# EasyEDA Pro project 电刺激_两块板_2026-10-19.epro, schematic Schematic2

## Sheets
1 NNC6121核心: Assembly Variant: Basic; Board Name: Board2; Create Date: 2026-09-04; Page Name: P1; Project Name: 电刺激_两块板; Schematic Name: Schematic2; Update Date: 2026-09-04; Company: 嘉立创EDA; Page Size: A4; Version: V1.0
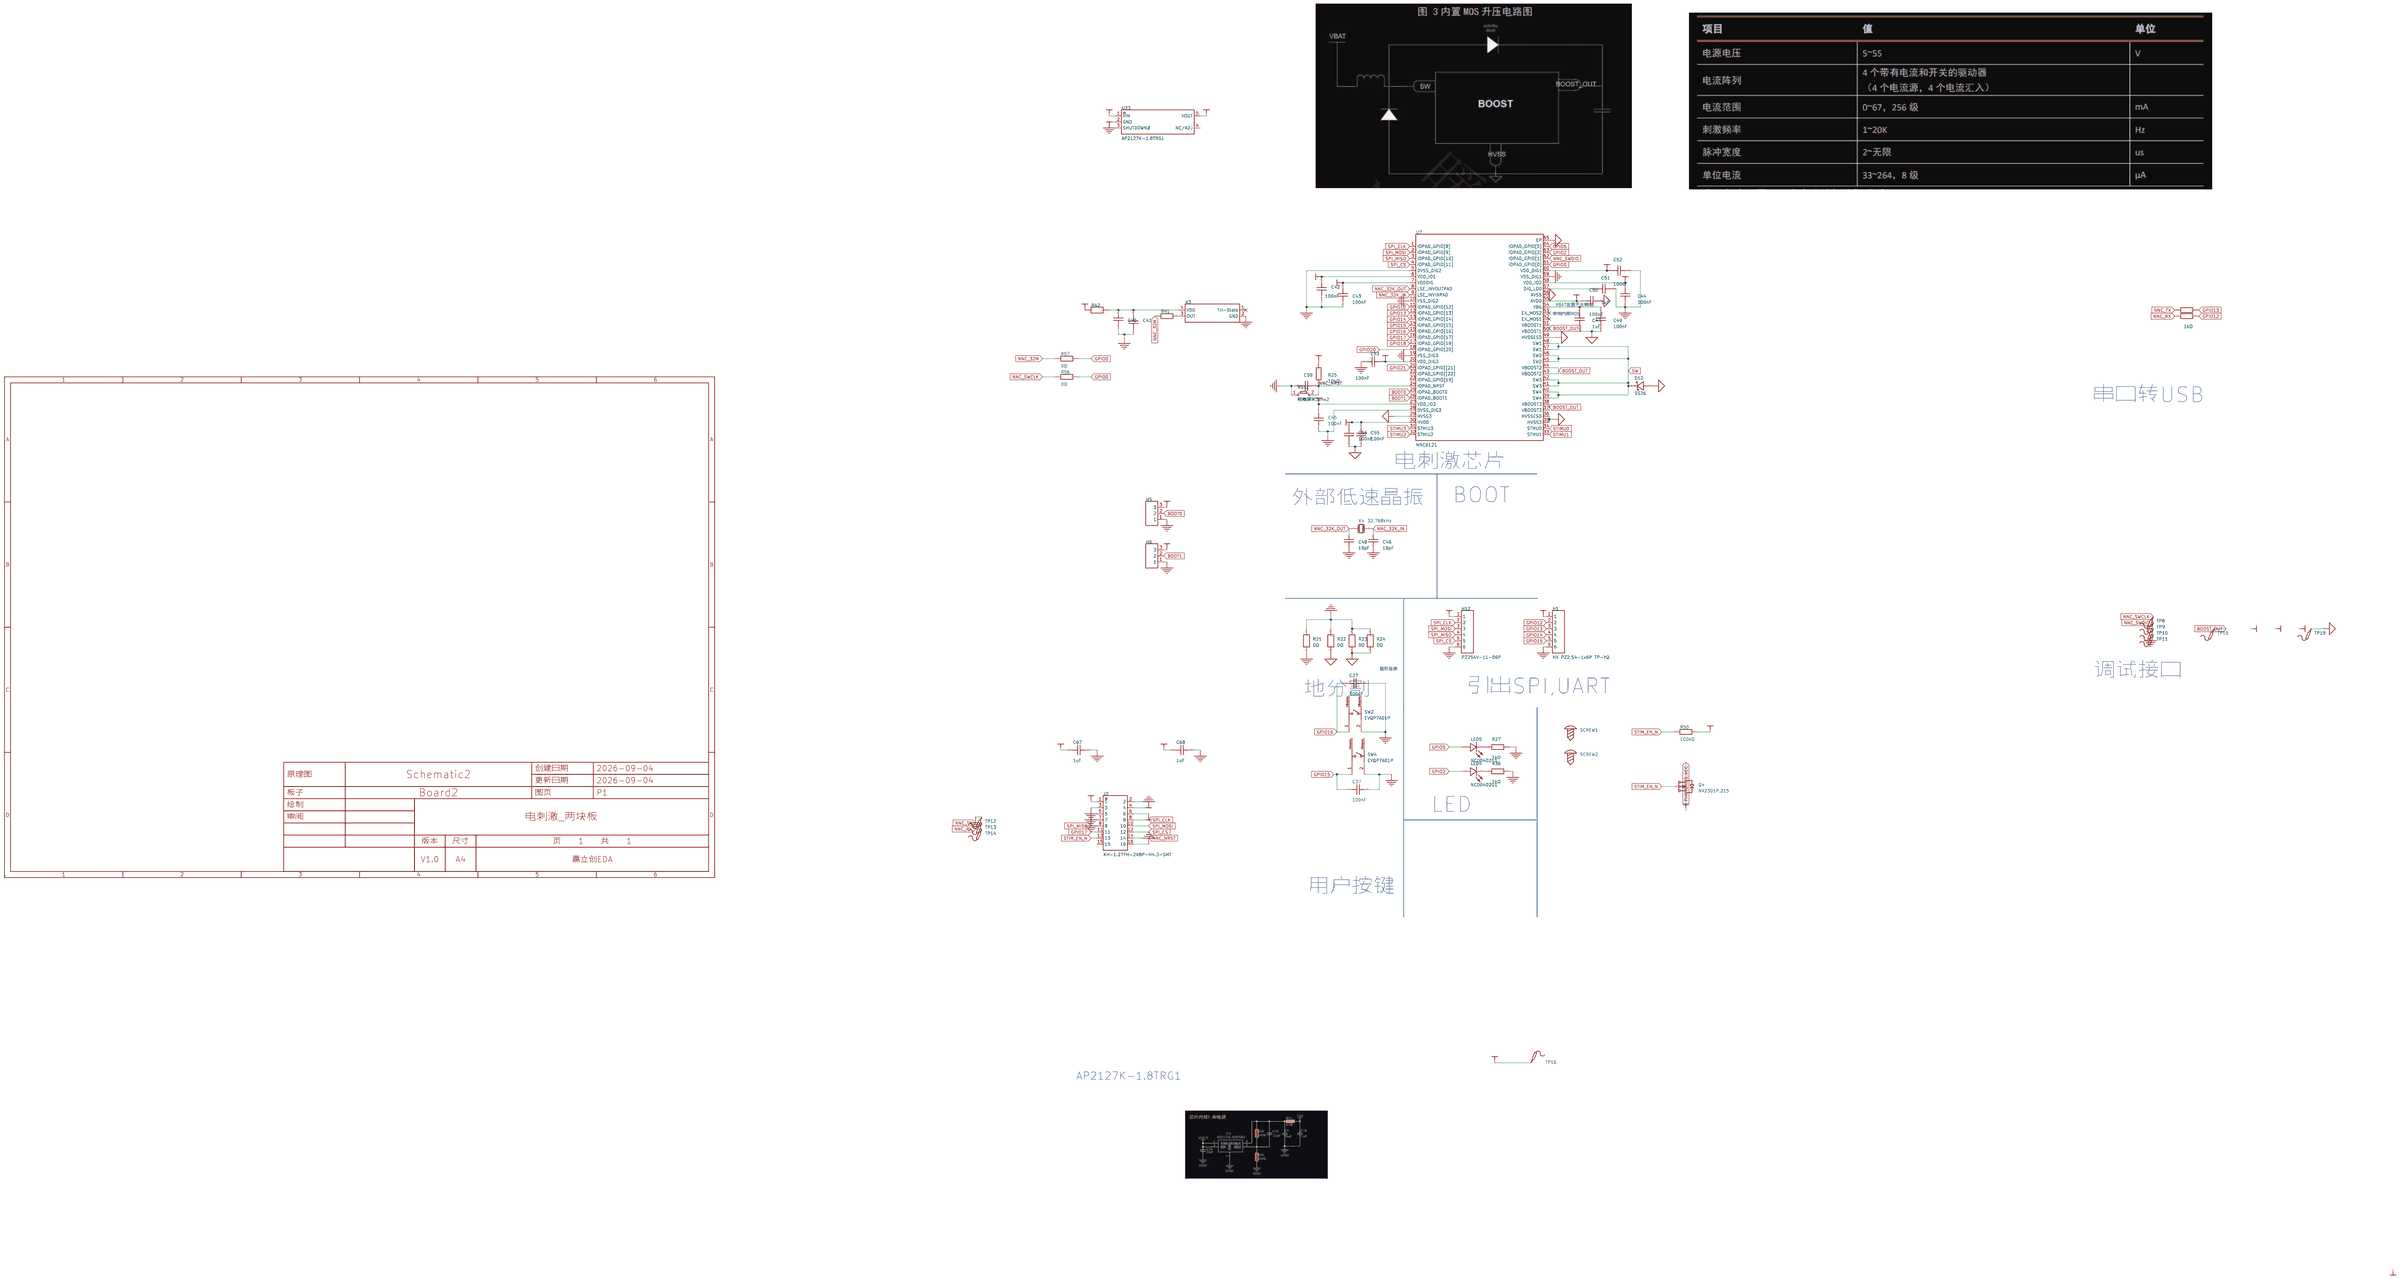
[diagram p0: NNC6121核心]
2 刺激输出: Board Name: 刺激板; Create Date: 2026-10-17; Update Date: 2026-10-17
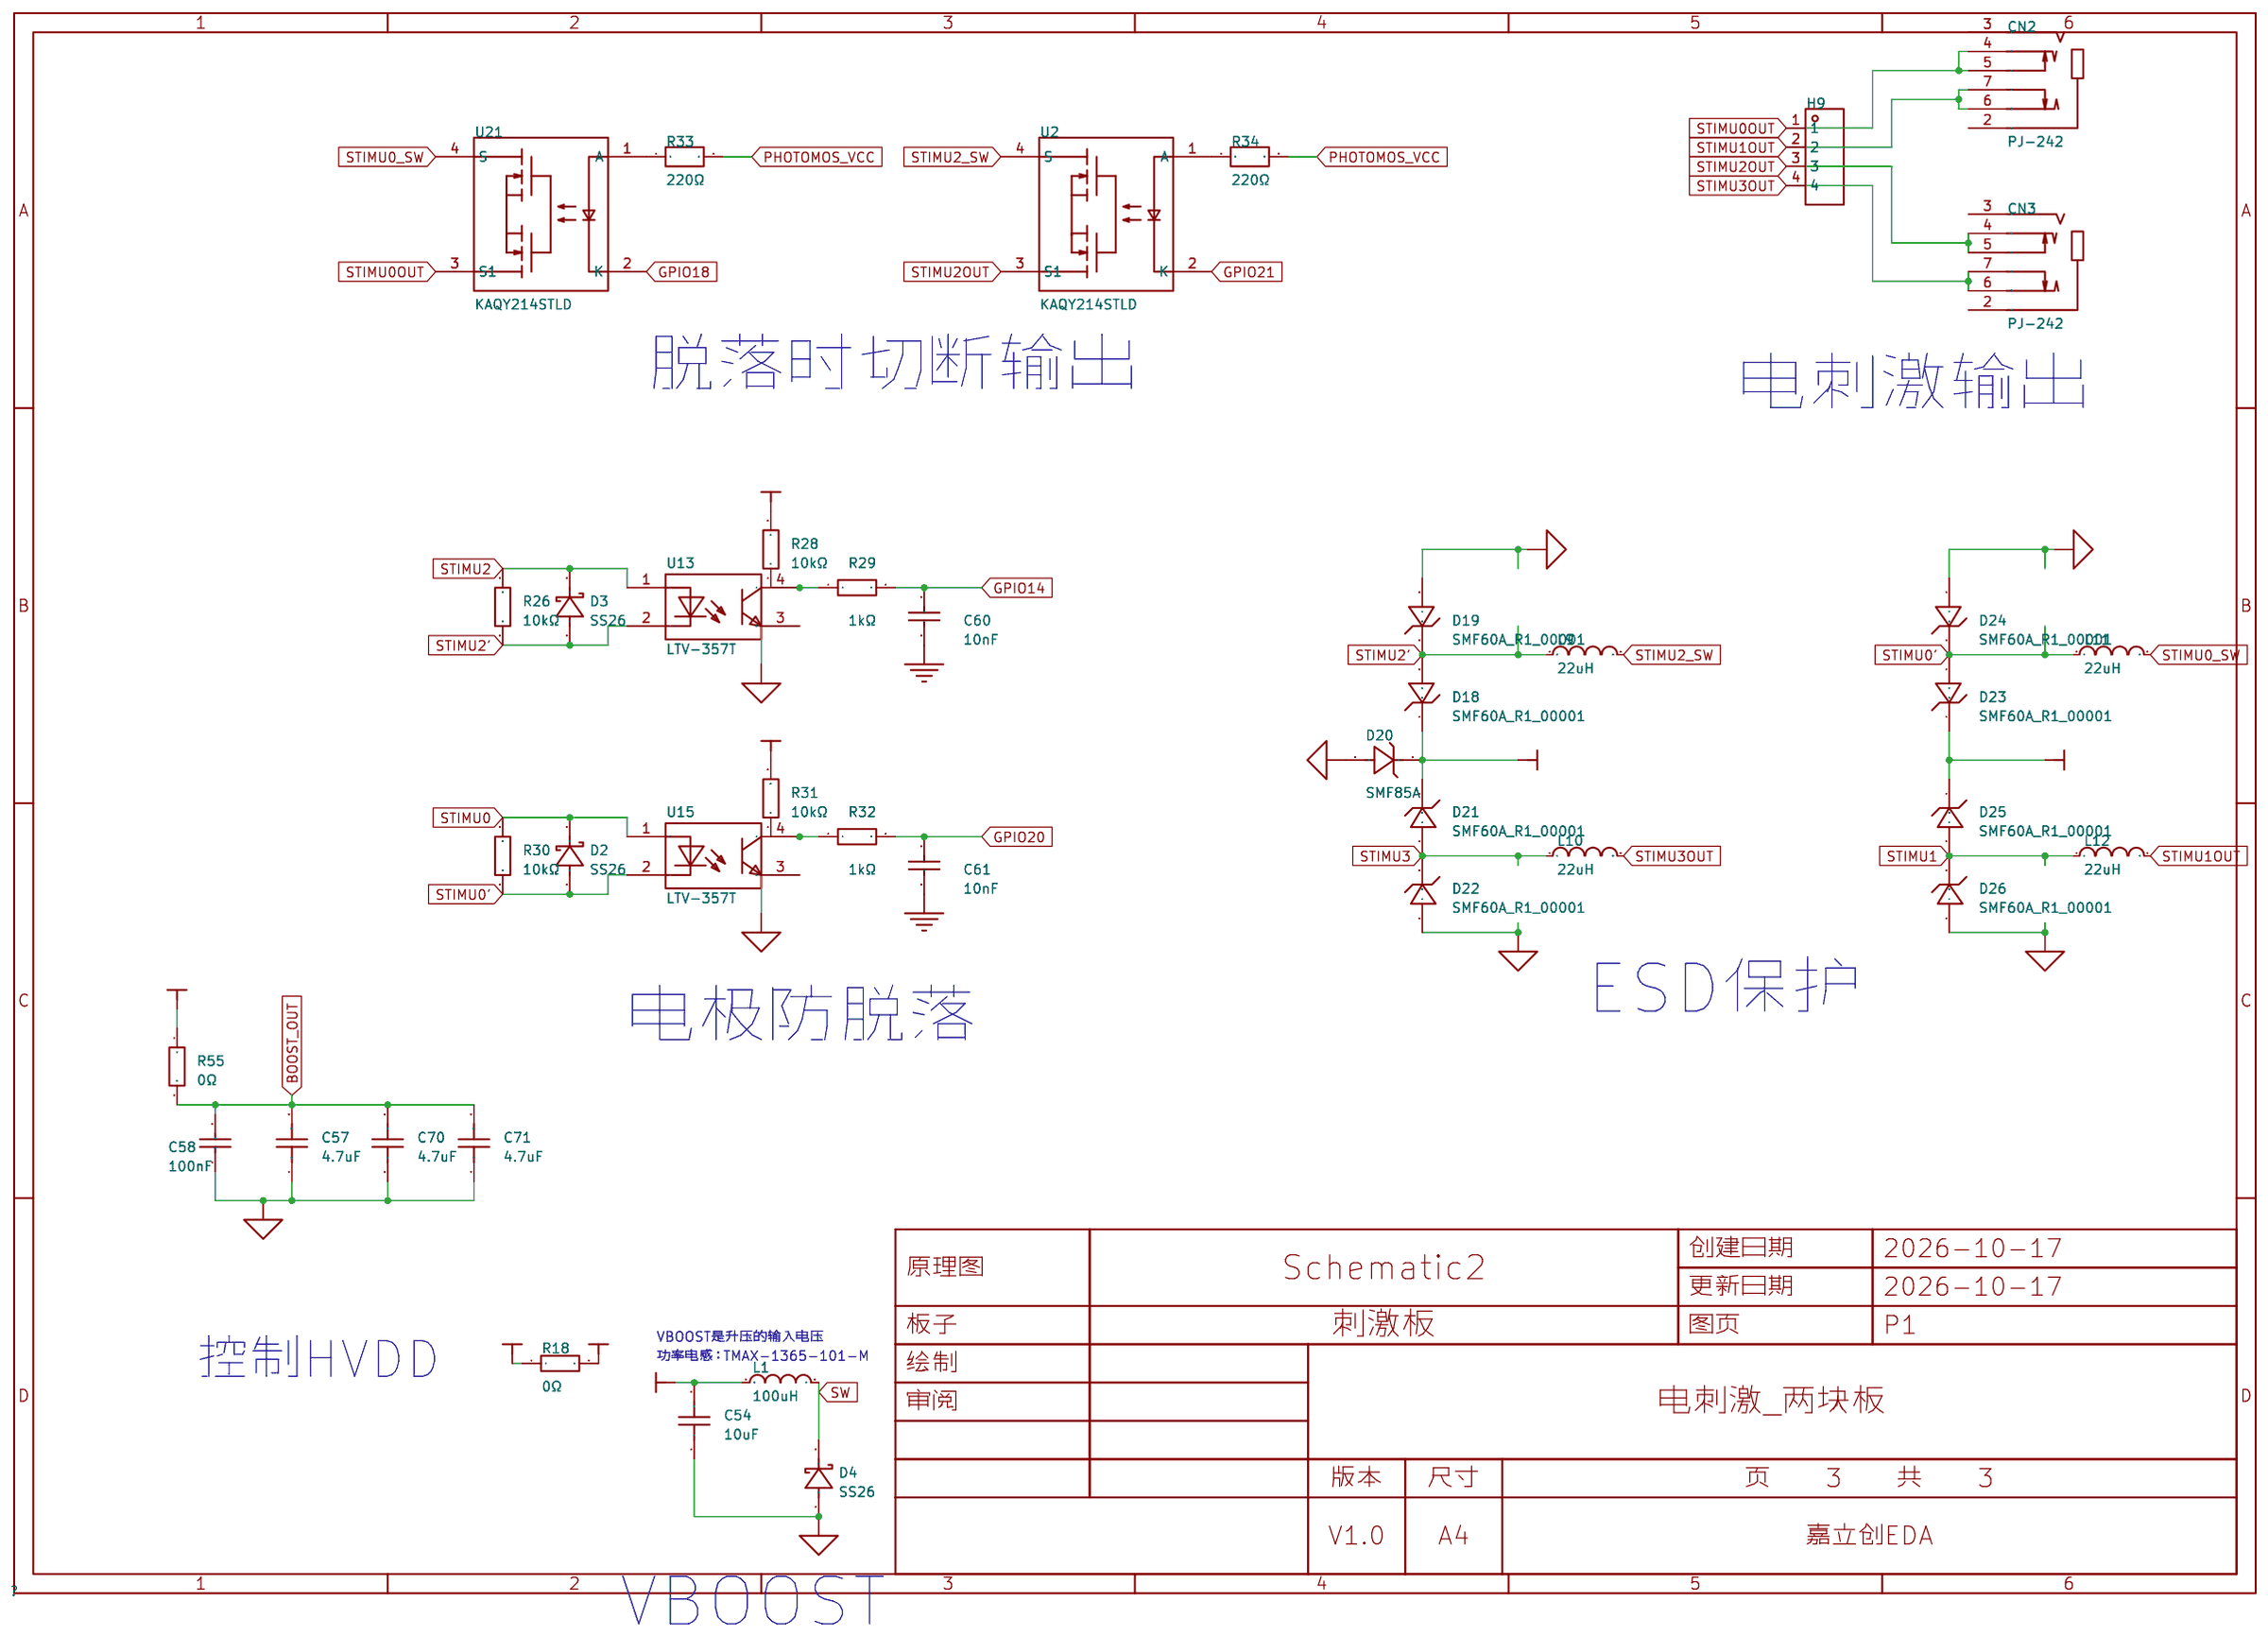
[diagram p1: 刺激输出]

## Parts
sheet NNC6121核心
C27  100nF  [C0402]
C37  100nF  [C0402]
C40  10uF  [C0402]  (no BOM)
C41  100nF  [C0402]  (no BOM)
C42  100nF  [C0402]
C43  100nF  [C0402]
C44  100nF  [C0402]
C45  100nF  [C0402]
C46  18pF  [C0402]
C47  1uF  [C0402]
C48  18pF  [C0402]
C49  100nF  [C0402]
C50  100nF  [C0402]
C51  1uF  [C0402]
C52  100nF  [C0402]
C53  100nF  [C0402]
C55  100nF  [C0603]
C56  100nF  [C0603]
C59  1uF  [C0402]
C67  1uF  [C0402]
C68  1uF  [C0402]
D12  SS26  [SMA_L4.3-W2.6-LS5.0-FD]
H1  HX PZ2.54-1x6P TP-YQ  [HDR-SMD_6P-HX-PZ2.54-1X6P-TP-YQ]  (no BOM)
H5  12251103CNG0S115001  [HDR-TH_3P-P2.54-V-M-1]  (no BOM)
H6  12251103CNG0S115001  [HDR-TH_3P-P2.54-V-M-1]  (no BOM)
H12  PZ254V-11-06P  [HDR-TH_6P-P2.54-V-M]  (no BOM)
J2  KH-1.27FH-2X8P-H4.3-SMT  [CONN-SMD_16P-P1.27_KINGHELM_KH-1.27FH-2X8P-H4.3-SMT]
LED4  NCD0402G1  [LED-SMD_L1.0-W0.5_FC-F1005UGK]
LED5  NCD0402G1  [LED-SMD_L1.0-W0.5_FC-F1005UGK]
Q4  NX2301P,215  [SOT-23-3_L2.9-W1.3-P1.90-LS2.4-BR]
R19  1kΩ  [R0402]
R20  1kΩ  [R0402]
R21  0Ω  [R0805]
R22  0Ω  [R0805]
R23  0Ω  [R0805]
R24  0Ω  [R0805]
R25  10kΩ  [R0402]
R27  1kΩ  [R0402]
R36  1kΩ  [R0402]
R41  22Ω  [R0402]  (no BOM)
R42  120Ω  [R0402]  (no BOM)
R50  100kΩ  [R0402]
R56  0Ω  [R0603]
R57  0Ω  [R0603]  (no BOM)
RST1  轻触开关3x4x2  [Key_SMD_3x4x2]
SCREW1  -  [M2螺丝]  (no BOM)
SCREW2  -  [M2螺丝]  (no BOM)
SW2  EVQP7A01P  [SW-SMD_EVQP7A01P]
SW4  EVQP7A01P  [SW-SMD_EVQP7A01P]
TP8  -  [Test-Point-0.5mm]  (no BOM)
TP9  -  [Test-Point-0.5mm]  (no BOM)
TP10  -  [Test-Point-0.5mm]  (no BOM)
TP11  -  [Test-Point-0.5mm]  (no BOM)
TP12  -  [Test-Point-0.5mm]  (no BOM)
TP13  -  [Test-Point-0.5mm]  (no BOM)
TP14  -  [Test-Point-0.5mm]  (no BOM)
TP15  -  [Test-Point-0.5mm]  (no BOM)
TP16  -  [Test-Point-0.5mm]  (no BOM)
TP19  -  [Test-Point-0.5mm]  (no BOM)
U7  NNC6121  [QFN-64_L7.0-W7.0-P0.35-TL-EP4.0]
U23  AP2127K-1.8TRG1  [SOT-23-5_L3.0-W1.7-P0.95-LS2.8-BR]
X3  32MHz  [OSC-SMD_4P-L2.0-W1.6-BL]  (no BOM)
X4  32.768kHz  [OSC-SMD_2P-L3.2-W1.5]
sheet 刺激输出
C54  10uF  [C0805]
C57  4.7uF  [C1210]
C58  100nF  [C0805]
C60  10nF  [C0402]
C61  10nF  [C0402]
C70  4.7uF  [C1210]
C71  4.7uF  [C1210]
CN2  PJ-242  [AUDIO-SMD_PJ-242_1]  (no BOM)
CN3  PJ-242  [AUDIO-SMD_PJ-242_1]  (no BOM)
D2  SS26  [SMA_L4.3-W2.6-LS5.0-FD]
D3  SS26  [SMA_L4.3-W2.6-LS5.0-FD]
D4  SS26  [SMA_L4.3-W2.6-LS5.0-FD]
D18  SMF60A_R1_00001  [SOD-123FL_L2.7-W1.8-LS3.8-RD]
D19  SMF60A_R1_00001  [SOD-123FL_L2.7-W1.8-LS3.8-RD]
D20  SMF85A  [SOD-123FL_L2.7-W1.8-LS3.7-RD]
D21  SMF60A_R1_00001  [SOD-123FL_L2.7-W1.8-LS3.8-RD]
D22  SMF60A_R1_00001  [SOD-123FL_L2.7-W1.8-LS3.8-RD]
D23  SMF60A_R1_00001  [SOD-123FL_L2.7-W1.8-LS3.8-RD]
D24  SMF60A_R1_00001  [SOD-123FL_L2.7-W1.8-LS3.8-RD]
D25  SMF60A_R1_00001  [SOD-123FL_L2.7-W1.8-LS3.8-RD]
D26  SMF60A_R1_00001  [SOD-123FL_L2.7-W1.8-LS3.8-RD]
H9  PZ254V-11-04P  [HDR-TH_4P-P2.54-V-M]
L1  100uH  [IND-SMD_L7.1-W6.6]
L9  22uH  [IND-SMD_L2.5-W2.0_SWPA252012S]
L10  22uH  [IND-SMD_L2.5-W2.0_SWPA252012S]
L11  22uH  [IND-SMD_L2.5-W2.0_SWPA252012S]
L12  22uH  [IND-SMD_L2.5-W2.0_SWPA252012S]
R18  0Ω  [R0603]
R26  10kΩ  [R0402]
R28  10kΩ  [R0402]
R29  1kΩ  [R0402]
R30  10kΩ  [R0402]
R31  10kΩ  [R0402]
R32  1kΩ  [R0402]
R33  220Ω  [R0402]
R34  220Ω  [R0402]
R55  0Ω  [R0603]  (no BOM)
U2  KAQY214STLD  [SOP-4_L3.9-W4.4-P2.54-LS7.0-BR]
U13  LTV-357T  [SOP-4_L3.9-W4.4-P2.54-LS7.0-TL]
U15  LTV-357T  [SOP-4_L3.9-W4.4-P2.54-LS7.0-TL]
U21  KAQY214STLD  [SOP-4_L3.9-W4.4-P2.54-LS7.0-BR]

## Library data of the parts
C27 C37 C42-C45 C49 C50 C52 C53 = CL05B104KB54PNC: 容值:100nF;精度:±10%;额定电压:50V;温度系数:X7R;; LCSC Part Name: 100nF ±10% 50V; Supplier Part: C307331; Manufacturer: SAMSUNG(三星); Supplier Footprint: 0402; JLCPCB Part Class: Basic Part; Datasheet: https://item.szlcsc.com/datasheet/CL05B104KB54PNC/291005.html; Supplier: LCSC; Tolerance: ±10%; Voltage Rating: 50V; Temperature Coefficient: X7R
C40 = CL05A106MQ5NUNC: 容值:10uF;精度:±20%;额定电压:6.3V;温度系数:X5R;; LCSC Part Name: 10uF ±20% 6.3V; Supplier Part: CL05A106MQ5NUNC.1; Manufacturer: SAMSUNG(三星); Supplier Footprint: 0402; JLCPCB Part Class: Basic Part; Datasheet: https://item.szlcsc.com/datasheet/CL05A106MQ5NUNC/16204.html; Supplier: LCSC; Tolerance: ±20%; Voltage Rating: 6.3V; Temperature Coefficient: X5R
C41 = CL05B104KB54PNC: 容值:100nF;精度:±10%;额定电压:50V;温度系数:X7R;; LCSC Part Name: 100nF ±10% 50V; Supplier Part: CL05B104KB54PNC.1; Manufacturer: SAMSUNG(三星); Supplier Footprint: 0402; JLCPCB Part Class: Basic Part; Datasheet: https://item.szlcsc.com/datasheet/CL05B104KB54PNC/291005.html; Supplier: LCSC; Tolerance: ±10%; Voltage Rating: 50V; Temperature Coefficient: X7R
C46 C48 = GJM1555C1H150FB01D: 容值:18pF;精度:±5%;额定电压:50V;材质(温度系数):C0G;; LCSC Part Name: 18pF ±5% 50V; Supplier Part: C1549; Manufacturer: FH(风华); Manufacturer Part: 0402CG180J500NT; Supplier Footprint: 0402; JLCPCB Part Class: Basic Part; Datasheet: https://atta.szlcsc.com/upload/public/pdf/source/20200305/C490387_23319AE8C154DEB24C505E6C82A8106A.pdf; Supplier: LCSC; Tolerance: ±5%; Voltage Rated: 50V; Temperature Coefficient: C0G
C47 C51 C59 C67 C68 = CL05A105KA5NQNC: 容值:1uF;精度:±10%;额定电压:25V;温度系数:X5R;; LCSC Part Name: 1uF ±10% 25V; Supplier Part: C52923; Manufacturer: SAMSUNG(三星); Supplier Footprint: 0402; JLCPCB Part Class: Basic Part; Datasheet: https://item.szlcsc.com/datasheet/CL05A105KA5NQNC/53938.html; Supplier: LCSC; Tolerance: ±10%; Voltage Rating: 25V; Temperature Coefficient: X5R
C55 C56 = CL10B104KC8NNNC: 容值:100nF;精度:±10%;额定电压:100V;温度系数:X7R;; LCSC Part Name: 100nF ±10% 100V; Supplier Part: C15725; Manufacturer: SAMSUNG(三星); Supplier Footprint: 0603; JLCPCB Part Class: Extended Part; Datasheet: https://item.szlcsc.com/datasheet/CL10B104KC8NNNC/16407.html; Supplier: LCSC; Tolerance: ±10%; Voltage Rating: 100V; Temperature Coefficient: X7R
D2-D4 D12 = SS26_C7420363: 二极管配置:独立式;正向压降(Vf):700mV@2A;直流反向耐压(Vr):60V;整流电流:2A;; LCSC Part Name: 电压:60V 电流:2A; Supplier Part: C7420363; Manufacturer: R+O(宏嘉诚); Supplier Footprint: SMA(DO-214AC); JLCPCB Part Class: Extended Part; Datasheet: https://item.szlcsc.com/datasheet/SS26/8397185.html; Supplier: LCSC; Diode Configuration: 独立式; Voltage - Forward(Vf@If): 700mV@2A; Voltage - DC Reverse(Vr): 60V; Current - Rectified: 2A; Reverse Leakage Current (Ir): 200uA@60V; Operating Junction Temperature Range: -55℃~+150℃; Non-Repetitive Peak Forward Surge Current: 50A
H1 = HX PZ2.54-1x6P TP-YQ: 插针结构:1x6P;间距:2.54mm;行距:-;圆针/方针:方针;安装方式:立贴;排数:单排;总PIN位数:6P;额定电流:3A;额定电压:1kV;配合针长度:6mm;塑高:2.5mm;端接针长度:-;触头材质:黄铜;触头镀层:金;工作温度:-40℃~+105℃;颜色:黑色;; LCSC Part Name: 1x6P 间距:2.54mm 方针 立贴; Supplier Part: C41417363; Manufacturer: hanxia(韩下); Supplier Footprint: SMD,P=2.54mm(交错脚); JLCPCB Part Class: Extended Part; Datasheet: https://item.szlcsc.com/datasheet/HX%2520PZ2.54-1x6P%2520TP-YQ/43243367.html; Supplier: LCSC; Pin Structure: 1x6P; Pitch: 2.54mm; Circluar Pins/Square Pins: 方针; Mounting Type: 立贴; Number of Rows: 单排; Number of Pins: 6P; Current Rating: 3A; Voltage Rating (Max): 1kV; Length of Mating Pin: 6mm; Insulation Height: 2.5mm; Contact Material: 黄铜; Contact Plating: 金; Operating Temperature: -40℃~+105℃; Color: 黑色
H5 H6 = 12251103CNG0S115001: 插针结构:1x3P;间距:2.54mm;行距:-;圆针/方针:方针;安装方式:直插;排数:单排;总PIN位数:3P;额定电流:3A;额定电压:-;配合针长度:6mm;塑高:2.5mm;端接针长度:3mm;触头材质:黄铜;触头镀层:-;工作温度:-40℃~+105℃;颜色:黑色;; LCSC Part Name: 1x3P 间距:2.54mm 方针 直插; Supplier Part: C429954; Manufacturer: JILN(锦凌); Supplier Footprint: 插件,P=2.54mm; JLCPCB Part Class: Extended Part; Datasheet: https://item.szlcsc.com/datasheet/12251103CNG0S115001/426406.html; Supplier: LCSC; Pin Structure: 1x3P; Pitch: 2.54mm; Circluar Pins/Square Pins: 方针; Mounting Type: 直插; Number of Rows: 单排; Number of Pins: 3P; Current Rating: 3A; Length of Mating Pin: 6mm; Insulation Height: 2.5mm; Length of End Connection Pin: 3mm; Contact Material: 黄铜; Operating Temperature: -40℃~+105℃; Color: 黑色
H12 = PZ254V-11-06P: 插针结构:1x6P;间距:2.54mm;行距:-;圆针/方针:方针;安装方式:直插;排数:单排;总PIN位数:6P;额定电流:3A;额定电压:250V;配合针长度:6mm;塑高:2.5mm;端接针长度:3mm;触头材质:黄铜;触头镀层:-;工作温度:-40℃~+105℃;颜色:黑色;; LCSC Part Name: 1x6P 间距:2.54mm 方针 直插; Supplier Part: C492405; Manufacturer: XFCN(兴飞); Supplier Footprint: 插件,P=2.54mm; JLCPCB Part Class: Extended Part; Datasheet: https://item.szlcsc.com/datasheet/PZ254V-11-06P/502961.html; Supplier: LCSC; Pin Structure: 1x6P; Pitch: 2.54mm; Circluar Pins/Square Pins: 方针; Mounting Type: 直插; Number of Rows: 单排; Number of Pins: 6P; Current Rating: 3A; Voltage Rating (Max): 250V; Length of Mating Pin: 6mm; Insulation Height: 2.5mm; Length of End Connection Pin: 3mm; Contact Material: 黄铜; Operating Temperature: -40℃~+105℃; Color: 黑色
J2 = KH-1.27FH-2X8P-H4.3-SMT: 插孔结构:2x8P;间距:1.27mm;行距:1.27mm;圆孔/方孔:方孔;安装方式:立贴;排数:双排;总孔位数:16P;额定电流:1A;额定电压:-;插孔方向:顶部;塑高:4.3mm;工作温度:-40℃~+105℃;; LCSC Part Name: 间距:1.27mm 2x8P 立贴; Supplier Part: C2938398; Manufacturer: kinghelm(金航标); Supplier Footprint: SMD,P=1.27mm; JLCPCB Part Class: Extended Part; Datasheet: https://item.szlcsc.com/datasheet/KH-1.27FH-2X8P-H4.3-SMT/3294778.html; Supplier: LCSC; Holes Structure: 2x8P; Pitch: 1.27mm; Row Spacing: 1.27mm; Circular Hole / Square Hole: 方孔; Mounting Type: 立贴; Number of Rows: 双排; Number of Positions: 16P; Current Rating: 1A; Holes Direction: 顶部; Insulation Height: 4.3mm; Operating Temperature: -40℃~+105℃
LED4 LED5 = NCD0402G1: 灯头类型:-;发光颜色:翠绿色;正向压降(Vf):2.6V~3.6V;功率:72mW;正向电流:20mA;波长:515nm~530nm;二极管配置:独立二极管;透镜颜色:-;色温:-;发光强度:270mcd;发光角度:130°;载带方式:-;工作温度:-30℃~+85℃;; LCSC Part Name: 片式发光二极管; Supplier Part: C130723; Manufacturer: 国星光电; Supplier Footprint: 0402; JLCPCB Part Class: Extended Part; Datasheet: https://item.szlcsc.com/datasheet/NCD0402G1/142012.html; Supplier: LCSC; Illumination Color: 翠绿色; Voltage - Forward(Vf): 2.6V~3.6V; Power(Watts): 72mW; Forward Current: 20mA; Wavelength - Dominant: 515nm~530nm; Peak Wavelength: 520nm; Diode Configuration: 独立二极管; Luminous Intensity: 270mcd; Viewing Angle: 130°; Operating Temperature: -30℃~+85℃
Q4 = NX2301P,215: 数量:1个P沟道;漏源电压(Vdss):20V;连续漏极电流(Id):2A;导通电阻(RDS(on)):120mΩ@4.5V;耗散功率(Pd):400mW;阈值电压(Vgs(th)):1.1V;; LCSC Part Name: 1个P沟道 耐压:20V 电流:2A; Supplier Part: C191273; Manufacturer: Nexperia(安世); Supplier Footprint: SOT-23; JLCPCB Part Class: Extended Part; Datasheet: https://item.szlcsc.com/datasheet/NX2301P%252C215/214510.html; Supplier: LCSC; Number: 1个P沟道; Drain to Source Voltage: 20V; Current - Continuous Drain(Id): 2A; RDS(on): 120mΩ@4.5V; Pd - Power Dissipation: 400mW; Gate Threshold Voltage (Vgs(th)): 1.1V; Gate Charge(Qg): 6nC@4.5V; Input Capacitance(Ciss): 380pF; Reverse Transfer Capacitance (Crss@Vds): 115pF; Operating Temperature: -55℃~+150℃; Type: P沟道; Output Capacitance(Coss): 135pF; Vgs: ±8V
R19 R20 R27 R29 R32 R36 = RC0402FR-071KL: 电阻类型:厚膜电阻;阻值:1kΩ;精度:±1%;功率:62.5mW;工作电压:50V;温度系数:±100ppm/℃;; LCSC Part Name: 厚膜电阻 1kΩ ±1% 62.5mW; Supplier Part: C106235; Manufacturer: YAGEO(国巨); Supplier Footprint: 0402; JLCPCB Part Class: Extended Part; Datasheet: https://item.szlcsc.com/datasheet/RC0402FR-071KL/107450.html; Supplier: LCSC; Type: 厚膜电阻; Tolerance: ±1%; Power(Watts): 62.5mW; Voltage-Supply(Max): 50V; Temperature Coefficient: ±100ppm/℃; Operating Temperature: -55℃~+155℃
R21-R24 = RE0805FAR000: 电阻类型:合金电阻;阻值:0Ω;精度:±1%;功率:500mW;温度系数:±50ppm/℃;安装方式:贴片;; LCSC Part Name: 0Ω ±1% 125mW 厚膜电阻; Supplier Part: C17477; Manufacturer: UNI-ROYAL(厚声); Manufacturer Part: 0805W8F0000T5E; Supplier Footprint: 0805; JLCPCB Part Class: Basic Part; Datasheet: https://item.szlcsc.com/datasheet/0805W8F0000T5E/18165.html; Supplier: LCSC; Type: 厚膜电阻; Tolerance: ±1%; Power(Watts): 125mW; Temperature Coefficient: ±800ppm/℃; Mounting Type: 贴片; Voltage-Supply(Max): 150V; Operating Temperature: -55℃~+155℃
R25 R26 R28 R30 R31 = RT0402BRD0710KL: 电阻类型:薄膜电阻;阻值:10kΩ;精度:±0.1%;功率:62.5mW;工作电压:50V;温度系数:±25ppm/℃;; LCSC Part Name: 薄膜电阻 10kΩ ±0.1% 62.5mW; Supplier Part: C190095; Manufacturer: YAGEO(国巨); Supplier Footprint: 0402; JLCPCB Part Class: Extended Part; Datasheet: https://item.szlcsc.com/datasheet/RT0402BRD0710KL/208478.html; Supplier: LCSC; Type: 薄膜电阻; Tolerance: ±0.1%; Power(Watts): 62.5mW; Voltage-Supply(Max): 50V; Temperature Coefficient: ±25ppm/℃; Operating Temperature: -55℃~+155℃
R41 = 0402WGJ0220TCE: 电阻类型:厚膜电阻;阻值:22Ω;精度:±5%;功率:62.5mW;工作电压:50V;温度系数:±100ppm/℃;; LCSC Part Name: 22Ω ±5% 62.5mW 厚膜电阻; Supplier Part: 0402WGJ0220TCE.1; Manufacturer: UNI-ROYAL(厚声); Supplier Footprint: 0402; JLCPCB Part Class: Extended Part; Datasheet: https://item.szlcsc.com/datasheet/0402WGJ0220TCE/25895.html; Supplier: LCSC; Type: 厚膜电阻; Tolerance: ±5%; Power(Watts): 62.5mW; Voltage-Supply(Max): 50V; Temperature Coefficient: ±100ppm/℃; Operating Temperature: -55℃~+155℃
R42 = ERJ2RKF1200X: 电阻类型:厚膜电阻;阻值:120Ω;精度:±1%;功率:100mW;最大工作电压:-;温度系数:±100ppm/℃;; LCSC Part Name: 120Ω ±1% 100mW 厚膜电阻; Supplier Part: ERJ2RKF1200X.1; Manufacturer: PANASONIC(松下); Supplier Footprint: 0402; JLCPCB Part Class: Extended Part; Datasheet: https://atta.szlcsc.com/upload/public/pdf/source/20190820/C413065_DC6FBADB38D14E1C8267D4574BBF0082.pdf; Supplier: LCSC; Type: 厚膜电阻; Tolerance: ±1%; Power(Watts): 100mW; Temperature Coefficient: ±100ppm/℃; Operating Temperature Range: -55℃~+155℃
R50 = RC0402FR-07100KL: 电阻类型:厚膜电阻;阻值:100kΩ;精度:±1%;功率:62.5mW;工作电压:50V;温度系数:±100ppm/℃;; LCSC Part Name: 厚膜电阻 100kΩ ±1% 62.5mW; Supplier Part: C60491; Manufacturer: YAGEO(国巨); Supplier Footprint: 0402; JLCPCB Part Class: Extended Part; Datasheet: https://item.szlcsc.com/datasheet/RC0402FR-07100KL/61543.html; Supplier: LCSC; Type: 厚膜电阻; Tolerance: ±1%; Power(Watts): 62.5mW; Voltage-Supply(Max): 50V; Temperature Coefficient: ±100ppm/℃; Operating Temperature: -55℃~+155℃
R18 R56 R57 = 0603WAF0000T5E: 电阻类型:厚膜电阻;阻值:0Ω;精度:±1%;功率:100mW;工作电压:75V;温度系数:-;; LCSC Part Name: 厚膜电阻 0Ω ±1%; Supplier Part: C21189; Manufacturer: UNI-ROYAL(厚声); Supplier Footprint: 0603; JLCPCB Part Class: Basic Part; Datasheet: https://item.szlcsc.com/datasheet/0603WAF0000T5E/21903.html; Supplier: LCSC; Type: 厚膜电阻; Tolerance: ±1%; Power(Watts): 100mW; Voltage-Supply(Max): 75V; Operating Temperature: -55℃~+155℃
RST1 = Key_SMD_3x4x2: Supplier Footprint: SMD; Manufacturer: 国产; Supplier: LCSC; Supplier Part: C26638; LCSC Part Name: 4*3*2mm 立贴 轻触开关; JLCPCB Part Class: Extended Part; Datasheet: https://atta.szlcsc.com/upload/public/pdf/source/20150923/1457707412058.pdf; Circuit: 单刀单掷; Actuator Style: 圆形按钮; Mounting Style: 立贴; Switch Length: 4mm; Switch Width: 3mm; Switch Height: 2mm; Contact Current: 50mA; Voltage Rating (DC): 12V
SCREW1 SCREW2 = M2螺丝: Supplier Footprint: 插件; Supplier Part: M3螺丝.1
SW2 SW4 = EVQP7A01P: 电路结构:单刀单掷;按钮形状:矩形按钮;作用力:2.2N;安装方式:卧贴;开关长度:3.5mm;开关宽度:3.55mm;开关高度:1.35mm;触点电流:50mA;额定电压:12V;带灯:-;工作寿命:10万次;; LCSC Part Name: 3.5*3.55*1.35mm 卧贴 轻触开关; Supplier Part: C79167; Manufacturer: PANASONIC(松下); Supplier Footprint: SMD,3.5x3.6mm; JLCPCB Part Class: Extended Part; Datasheet: https://item.szlcsc.com/datasheet/EVQP7A01P/80304.html; Supplier: LCSC; Circuit: 单刀单掷; Actuator Style: 矩形按钮; Operating Force: 2.2N; Mounting Type: 卧贴; Length: 3.5mm; Width: 3.55mm; Switch Height: 1.35mm; Contact Current: 50mA; Voltage Rating: 12V; Termination Style: 焊片; Life: 10万次; Operating Temperature: -20℃~+70℃
TP8-TP15 TP19 = Test-Point: Test Point 测试点; Supplier Part: Test-Point.1
TP16 = Test-Point: Test Point 测试点
U7 = NNC6121: NNC6121芯片是一款集成了32MHz ARM处理器的双通道神经刺激芯片，能够实现DC到50kHz的任意恒流源波形输出，可以覆盖传统的正弦波/方波/三角波及各种调制波形，可应用于体外神经/肌肉电刺激等众多领域。电压最高为单向60V  刺激脉宽大于10us，量程：1~67mA，系统OSC：HSI_32M +-2%，产品FLASH空间：28KB; LCSC Part Name: 高集成可编程刺激芯片; Supplier Part: C42396791; Manufacturer: NANOCHAP(暖芯迦); Supplier Footprint: QFN-64L(7x7); JLCPCB Part Class: Extended Part; Datasheet: https://item.szlcsc.com/datasheet/NNC6121/44345719.html; Supplier: LCSC
U23 = AP2127K-1.8TRG1: 输出极性:正极;工作电压:6V;输出电压:1.8V;输出电流:300mA;电源纹波抑制比(PSRR):68dB@(1kHz);输出类型:固定;; LCSC Part Name: 1.8V 300mA 6V; Supplier Part: C151375; Manufacturer: DIODES(美台); Supplier Footprint: SOT-23-5; JLCPCB Part Class: Extended Part; Datasheet: https://item.szlcsc.com/datasheet/AP2127K-1.8TRG1/162715.html; Supplier: LCSC; Output Configuration: 正极; Voltage - Supply: 6V; Output Voltage: 1.8V; Output Current: 300mA; Power Supply Rejection Ratio (PSRR): 68dB@(1kHz); Voltage Dropout: 600mV@(300mA); standby current: 60uA; Noise: 60uVrms; Features: 使能控制；输出放电；内置软启动；过流保护；短路保护；热关断; Operating Temperature: -40℃~+85℃@(Ta); Output Type: 固定; Number of Outputs: 1
X3 = OT7EL89CJI-111YLC-32M: 频率:32MHz;常温频差:±10ppm;输出模式:CMOS;工作电压:1.8V~3.3V;频率稳定度:±20ppm;; LCSC Part Name: YSO110TR 32MHZ 1.8V-3.3V ±10PPM -40~85℃ (±20PPM) CMOS; Supplier Part: OT7EL89CJI-111YLC-32M.1; Manufacturer: YXC(扬兴晶振); Supplier Footprint: SMD2016-4P; JLCPCB Part Class: Extended Part; Datasheet: https://item.szlcsc.com/datasheet/OT7EL89CJI-111YLC-32M/29374969.html; Supplier: LCSC; Normal temperature Frequency Tolerance: ±10ppm; Output Type: CMOS; Voltage - Supply: 1.8V~3.3V; Frequency Stability: ±20ppm; Operating Temperature: -40℃~+85℃
X4 = CM315D32768DZFT: 晶振类型:-;频率:32.768kHz;常温频差:±20ppm;外接负载电容:12.5pF;; LCSC Part Name: 32.768kHz ±20ppm 12.5pF; Supplier Part: C182057; Manufacturer: CITIZEN; Supplier Footprint: SMD3215-2P; JLCPCB Part Class: Extended Part; Datasheet: https://atta.szlcsc.com/upload/public/pdf/source/20180224/C182057_15194369676281363999.pdf; Supplier: LCSC; Normal temperature Frequency Tolerance: ±20ppm; External load capacitor: 12.5pF; Equivalent Series Resistance (ESR): 70kΩ; Operating Temperature: -40℃~+85℃
C54 = CGA0805X5R106K500MT: 容值:10uF;精度:±10%;额定电压:50V;温度系数:X5R;; LCSC Part Name: 10uF ±10% 50V; Supplier Part: C6119889; Manufacturer: HRE(芯声); Supplier Footprint: 0805; JLCPCB Part Class: Extended Part; Datasheet: https://item.szlcsc.com/datasheet/CGA0805X5R106K500MT/7062595.html; Supplier: LCSC; Tolerance: ±10%; Voltage Rating: 50V; Temperature Coefficient: X5R
C57 C70 C71 = GRM32ER72A475KE14L: 容值:4.7uF;精度:±10%;额定电压:100V;温度系数:X7R;; LCSC Part Name: 4.7uF ±10% 100V; Supplier Part: C162515; Manufacturer: muRata(村田); Supplier Footprint: 1210; JLCPCB Part Class: Extended Part; Datasheet: https://item.szlcsc.com/datasheet/GRM32ER72A475KE14L/173896.html; Supplier: LCSC; Tolerance: ±10%; Voltage Rating: 100V; Temperature Coefficient: X7R
C58 = CL21B104KCFNNNE: 容值:100nF;精度:±10%;额定电压:100V;温度系数:X7R;; LCSC Part Name: 100nF ±10% 100V; Supplier Part: C28233; Manufacturer: SAMSUNG(三星); Supplier Footprint: 0805; JLCPCB Part Class: Basic Part; Datasheet: https://item.szlcsc.com/datasheet/CL21B104KCFNNNE/28983.html; Supplier: LCSC; Tolerance: ±10%; Voltage Rating: 100V; Temperature Coefficient: X7R
C60 C61 = CL05B103KB5NNNC: 容值:10nF;精度:±10%;额定电压:50V;温度系数:X7R;; LCSC Part Name: 10nF ±10% 50V; Supplier Part: C15195; Manufacturer: SAMSUNG(三星); Supplier Footprint: 0402; JLCPCB Part Class: Basic Part; Datasheet: https://item.szlcsc.com/datasheet/CL05B103KB5NNNC/15869.html; Supplier: LCSC; Tolerance: ±10%; Voltage Rating: 50V; Temperature Coefficient: X7R
CN2 CN3 = PJ-242_C431536: 连接器类型:2.5mm耳机座;额定电流:500mA;额定电压:30V;触头材质:铜;触头镀层:-;工作温度:-;; LCSC Part Name: PJ-242-6P双柱镀金散装; Supplier Part: C431536; Manufacturer: SHOU HAN(首韩); Supplier Footprint: SMD; JLCPCB Part Class: Extended Part; Datasheet: https://item.szlcsc.com/datasheet/PJ-242/427893.html; Supplier: LCSC; Connector Type: 2.5mm耳机座; Current Rating: 500mA; Voltage Rating (Max): 30V; Contact Material: 铜
D18 D19 D21-D26 = SMF60A_R1_00001: 极性:单向;反向截止电压(Vrwm):60V;钳位电压:96.8V;峰值脉冲电流(Ipp):1.8A@10/1000us;峰值脉冲功率(Ppp):200W@10/1000us;击穿电压(VBR):73.7V;; LCSC Part Name: TVS 60V截止 峰值浪涌电流：1.8A@10/1000us; Supplier Part: C391710; Manufacturer: PANJIT(强茂); Supplier Footprint: SOD-123FL; JLCPCB Part Class: Extended Part; Datasheet: https://item.szlcsc.com/datasheet/SMF60A_R1_00001/368387.html; Supplier: LCSC; Polarity: 单向; Reverse Stand-Off Voltage (Vrwm): 60V; Clamping Voltage: 96.8V; Peak Pulse Current (Ipp): 1.8A@10/1000us; Peak Pulse Power Dissipation (Ppp): 200W@10/1000us; Voltage - Breakdown: 73.7V; Reverse Leakage Current (Ir): 1uA; Number of Channels: 单路; Operating Temperature: -55℃~+150℃; Type: TVS
D20 = SMF85A: 极性:单向;反向截止电压(Vrwm):85V;钳位电压:137V;峰值脉冲电流(Ipp):1.3A;峰值脉冲功率(Ppp):200W@10/1000us;击穿电压(VBR):94.4V;; LCSC Part Name: TVS 85V截止 峰值浪涌电流：1.3A; Supplier Part: C353253; Manufacturer: 晶导微电子; Supplier Footprint: SOD-123FL; JLCPCB Part Class: Extended Part; Datasheet: https://item.szlcsc.com/datasheet/SMF85A/329002.html; Supplier: LCSC; Polarity: 单向; Reverse Stand-Off Voltage (Vrwm): 85V; Clamping Voltage: 137V; Peak Pulse Current (Ipp): 1.3A; Peak Pulse Power Dissipation (Ppp): 200W@10/1000us; Voltage - Breakdown: 94.4V; Reverse Leakage Current (Ir): 1uA; Number of Channels: 单路; Operating Temperature: -55℃~+150℃; Type: TVS
H9 = PZ254V-11-04P: 插针结构:1x4P;间距:2.54mm;行距:-;圆针/方针:方针;安装方式:直插;排数:单排;总PIN位数:4P;额定电流:3A;额定电压:250V;配合针长度:6mm;塑高:2.5mm;端接针长度:3mm;触头材质:-;工作温度:-40℃~+105℃;颜色:黑色;; LCSC Part Name: 1x4P 间距:2.54mm 方针 直插; Supplier Part: C2691448; Manufacturer: XFCN(兴飞); Supplier Footprint: 插件,P=2.54mm; JLCPCB Part Class: Extended Part; Datasheet: https://item.szlcsc.com/datasheet/PZ254V-11-04P/2801085.html; Supplier: LCSC; Pin Structure: 1x4P; Pitch: 2.54mm; Circluar Pins/Square Pins: 方针; Mounting Type: 直插; Number of Rows: 单排; Number of Pins: 4P; Current Rating: 3A; Voltage Rating (Max): 250V; Length of Mating Pin: 6mm; Insulation Height: 2.5mm; Length of End Connection Pin: 3mm; Operating Temperature: -40℃~+105℃; Color: 黑色
L1 = SMMS0650-101M: 电感值:100uH;精度:±20%;额定电流:1.5A;饱和电流(Isat):2A;类型:-;; LCSC Part Name: 100uH ±20% 2A; Supplier Part: C2894722; Manufacturer: SXN(顺翔诺); Supplier Footprint: SMD,6.6x7.1mm; JLCPCB Part Class: Extended Part; Datasheet: https://item.szlcsc.com/datasheet/SMMS0650-101M/3130469.html; Supplier: LCSC; Tolerance: ±20%; Current Rating: 1.5A; Current - Saturation(Isat): 2A; DC Resistance(DCR): 720mΩ
L9-L12 = SWPA252012S220MT: 电感值:22uH;精度:±20%;额定电流:380mA;饱和电流(Isat):530mA;类型:-;; LCSC Part Name: 22uH ±20% 530mA; Supplier Part: C65856; Manufacturer: Sunlord(顺络); Supplier Footprint: 1008; JLCPCB Part Class: Extended Part; Datasheet: https://atta.szlcsc.com/upload/public/pdf/source/20231024/317626D2AA2F8AB4113C1875E432E6E1.pdf; Supplier: LCSC; Tolerance: ±20%; Rated Current: 380mA; Current - Saturation(Isat): 530mA; DC Resistance(DCR): 1.52Ω
R33 R34 = FRC0402F4700TS: 电阻类型:厚膜电阻;阻值:470Ω;精度:±1%;功率:62.5mW;工作电压:50V;温度系数:±100ppm/℃;; LCSC Part Name: 220Ω ±1% 62.5mW 厚膜电阻; Supplier Part: C25091; Manufacturer: UNI-ROYAL(厚声); Manufacturer Part: 0402WGF2200TCE; Supplier Footprint: 0402; JLCPCB Part Class: Basic Part; Supplier: LCSC; Type: 厚膜电阻; Tolerance: ±1%; Power(Watts): 62.5mW; Voltage-Supply(Max): 50V; Temperature Coefficient: ±100ppm/℃; Operating Temperature: -55℃~+155℃
R55 = 0603WAF0000T5E: 电阻类型:厚膜电阻;阻值:0Ω;精度:±1%;功率:100mW;工作电压:75V;温度系数:-;; LCSC Part Name: 厚膜电阻 0Ω ±1%; Supplier Part: 0603WAF0000T5E.1; Manufacturer: UNI-ROYAL(厚声); Supplier Footprint: 0603; JLCPCB Part Class: Basic Part; Datasheet: https://item.szlcsc.com/datasheet/0603WAF0000T5E/21903.html; Supplier: LCSC; Type: 厚膜电阻; Tolerance: ±1%; Power(Watts): 100mW; Voltage-Supply(Max): 75V; Operating Temperature: -55℃~+155℃
U2 U21 = KAQY214STLD: 触点形式:SPST-NO(1 Form A);正向压降(Vf):1.2V;负载电压:400V;连续负载电流:130mA;导通电阻:20Ω;; LCSC Part Name: 1 Form A(SPSTNO) 负载AC,DC 负载电压400V; Supplier Part: C113331; Manufacturer: Cosmo(冠西); Supplier Footprint: SOP-4-2.54mm; JLCPCB Part Class: Extended Part; Datasheet: https://item.szlcsc.com/datasheet/KAQY214STLD/114566.html; Supplier: LCSC; Contact Form: SPST-NO(1 Form A); Voltage - Forward(Vf): 1.2V; Load Voltage: 400V; Load Current: 130mA; RDS(on): 20Ω; Isolation Voltage(Vrms): 1.5kV; Turn-on time: 300us; Turn-off time: 100us
U13 U15 = LTV-357T: 输入类型:DC;正向压降(Vf):1.2V;输出电流:50mA;隔离电压(Vrms):3.75kV;直流反向耐压(Vr):6V;负载电压:35V;集射极饱和电压(VCE(sat)):200mV;; Supplier Part: C119089; Manufacturer: LITEON(光宝); Supplier Footprint: SOP-4-2.54mm; JLCPCB Part Class: Extended Part; Datasheet: https://item.szlcsc.com/datasheet/LTV-357T/120358.html; Supplier: LCSC; Input type: DC; Voltage - Forward(Vf): 1.2V; Output Current: 50mA; Isolation Voltage(Vrms): 3.75kV; Reverse Voltage: 6V; Load Voltage: 35V; Vce Saturation(VCE(sat)): 200mV; Rise time: 4us; Fall time: 3us; Operating Temperature: -55℃~+110℃; Current Transfer Ratio (CTR) Minimum: 50%; Current Transfer Ratio (CTR) Maximum/Saturation Value: 600%; Forward Current(If): 50mA

## Nets
1V8: C43.2 C52.1 C53.2 C68.1 U7.7(VDDDIG) U7.20(VDD_DIG3) U7.60(VDD_DIG1) U23.5(VOUT)
AGND: C47.1 C49.2 C50.2 R23.1 R24.1 U7.56(AVSS)
DGND: C27.2 C37.2 C40.1 C41.1 C42.1 C43.1 C44.2 C45.2 C46.1 C48.1 C51.1 C52.2 C53.1 C59.2 C60.1 C61.1 C67.2 C68.2 H1.6 H5.1 H6.1 H12.6 R21.1 R27.2 R36.2 RST1.1 SW2.2 SW4.2 TP11.1 TP12.1 U7.5(DVSS_DIG2) U7.10(VSS_DIG2) U7.19(VSS_DIG3) U7.28(DVSS_DIG3) U7.59(VSS_DIG1) U23.2(GND) X3.2(GND)
GND: J2.3 J2.4 J2.5 J2.7 J2.16 R21.2 R22.2 R23.2 R24.2
VDD: C42.2 C44.1 C45.1 C67.1 H1.1 H5.3 H6.3 H12.1 J2.6 Q4.2(S) R25.2 R28.2 R31.2 R42.1 R50.2 TP10.1 U7.6(VDD_IO1) U7.27(VDD_IO3) U7.58(VDD_IO2) U23.1(VIN) U23.3(SHUTDOWN#)
BOOST_OUT: C57.2 C58.2 C70.2 C71.2 R55.2 TP15.1 U7.37(VBOOST3) U7.38(VBOOST3) U7.43(VBOOST2) U7.44(VBOOST2) U7.50(VBOOST1) U7.51(VBOOST1)
BOOT0: H5.2 U7.25(IOPAD_BOOT0)
BOOT1: H6.2 U7.26(IOPAD_BOOT1)
GPIO0: R56.2 R57.2 U7.61(IOPAD_GPIO[0])
GPIO2: LED4.2(A) U7.63(IOPAD_GPIO[2])
GPIO5: LED5.2(A) U7.64(IOPAD_GPIO[5])
GPIO12: H1.2 R20.2 U7.11(IOPAD_GPIO[12])
GPIO13: H1.3 R19.2 U7.12(IOPAD_GPIO[13])
GPIO14: C60.2 H1.4 R29.2 U7.13(IOPAD_GPIO[14])
GPIO15: C37.1 H1.5 SW4.1 U7.14(IOPAD_GPIO[15])
GPIO16: C27.1 SW2.1 U7.15(IOPAD_GPIO[16])
GPIO17: J2.11 U7.16(IOPAD_GPIO[17])
GPIO18: U7.17(IOPAD_GPIO[18]) U21.2(K)
GPIO20: C61.2 R32.2 U7.18(IOPAD_GPIO[20])
GPIO21: U2.2(K) U7.21(IOPAD_GPIO[[21])
HGND: C54.1 C55.2 C56.2 C57.1 C58.1 C70.1 C71.1 D4.1(A) D12.1(A) D19.2(A) D20.2(A) D22.2(A) D24.2(A) D26.2(A) R22.1 TP19.1 U7.29(HVSS3) U7.35(HVSS3) U7.36(HVSSESD) U7.49(HVSSESD) U7.65(EP) U13.3 U15.3
HVDD: C55.1 C56.1 D18.1(C) D20.1(C) D21.1(C) D23.1(C) D25.1(C) R55.1 TP16.1 U7.30(HVDD)
NNC_32K_IN: C46.2 U7.9(LSE_INVINPAD) X4.2(OSC2)
NNC_32K_OUT: C48.2 U7.8(LSE_INVOUTPAD) X4.1(OSC1)
NNC_32M: R41.1 R57.1
NNC_NRST: C59.1 J2.14 R25.1 RST1.2 U7.24(IOPAD_NRST)
NNC_RX: R20.1 TP14.1
NNC_SWCLK: R56.1 TP8.1
NNC_SWDIO: TP9.1 U7.62(IOPAD_GPIO[1])
NNC_TX: R19.1 TP13.1
PHOTOMOS_VCC: Q4.3(D) R33.2 R34.2
SPI_CLK: H12.2 J2.8 U7.1(IOPAD_GPIO[8])
SPI_CS: H12.5 J2.12 U7.4(IOPAD_GPIO[11])
SPI_MISO: H12.4 J2.9 U7.3(IOPAD_GPIO[10])
SPI_MOSI: H12.3 J2.10 U7.2(IOPAD_GPIO[9])
STIM_EN_N: J2.13 Q4.1(G) R50.1
STIMU0: D2.2(K) R30.2 U7.34(STMU0) U15.1
STIMU0': D2.1(A) D23.2(A) D24.1(C) L11.1 R30.1 U15.2
STIMU0_SW: L11.2 U21.4(S)
STIMU0OUT: CN2.4 CN2.5 H9.1 U21.3(S1)
STIMU1: D25.2(A) D26.1(C) L12.1 U7.33(STMU1)
STIMU1OUT: CN2.6 CN2.7 H9.2 L12.2
STIMU2: D3.2(K) R26.2 U7.32(STMIU2) U13.1
STIMU2': D3.1(A) D18.2(A) D19.1(C) L9.1 R26.1 U13.2
STIMU2_SW: L9.2 U2.4(S)
STIMU2OUT: CN3.4 CN3.5 H9.3 U2.3(S1)
STIMU3: D21.2(A) D22.1(C) L10.1 U7.31(STMIU3)
STIMU3OUT: CN3.6 CN3.7 H9.4 L10.2
SW: D4.2(K) D12.2(K) L1.2 U7.39(SW4) U7.40(SW4) U7.41(SW3) U7.42(SW3) U7.45(SW2) U7.46(SW2) U7.47(SW1) U7.48(SW1)
VBOOST: C54.2 L1.1 R18.2
VOUT: C50.1 J2.1 J2.2 R18.1 U7.55(AVDD)
$1N67: C51.2 U7.57(DIG_LD0)
$1N70: C47.2 C49.1 U7.54(VBG)
$1N156: R41.2 X3.3(OUT)
$1N159: C40.2 C41.2 R42.2 X3.4(VDD)
$1N168: LED4.1(K) R36.1
$1N169: LED5.1(K) R27.1
$3N6: R34.1 U2.1(A)
$3N9: R33.1 U21.1(A)
$3N15: R31.1 R32.1 U15.4
$3N16: R28.1 R29.1 U13.4

Not connected (* = marked no-connect by the designer): CN2 2 3; CN3 2 3; J2 15; SCREW1 1; SCREW2 1; SW2 1&apos; 2&apos;; SW4 1&apos; 2&apos;; U7 22(IOPAD_GPIO[[22]) 23(IOPAD_GPIO[19]) 52(EX_MOS1)* 53(EX_MOS2)*; U23 4(NC/ADJ); X3 1(Tri-State)*

## Notes on the sheets
sheet 1
- VBAT这里不太确定
- 使用内部MOS
- 串口转USB
- 电刺激芯片
- 外部低速晶振
- BOOT
- 调试接口
- 星形连接
- 地分割
- 引出SPI,UART
- LED
- 用户按键
- AP2127K-1.8TRG1
sheet 2
- 脱落时切断输出
- 电刺激输出
- ESD保护
- 电极防脱落
- VBOOST是升压的输入电压
- 功率电感：TMAX-1365-101-M
- 控制HVDD
- VBOOST
